# Altium schematic sheet Full_Proje_Sematik.SchDoc
size A4; SheetNumber: 1; SheetTotal: 3
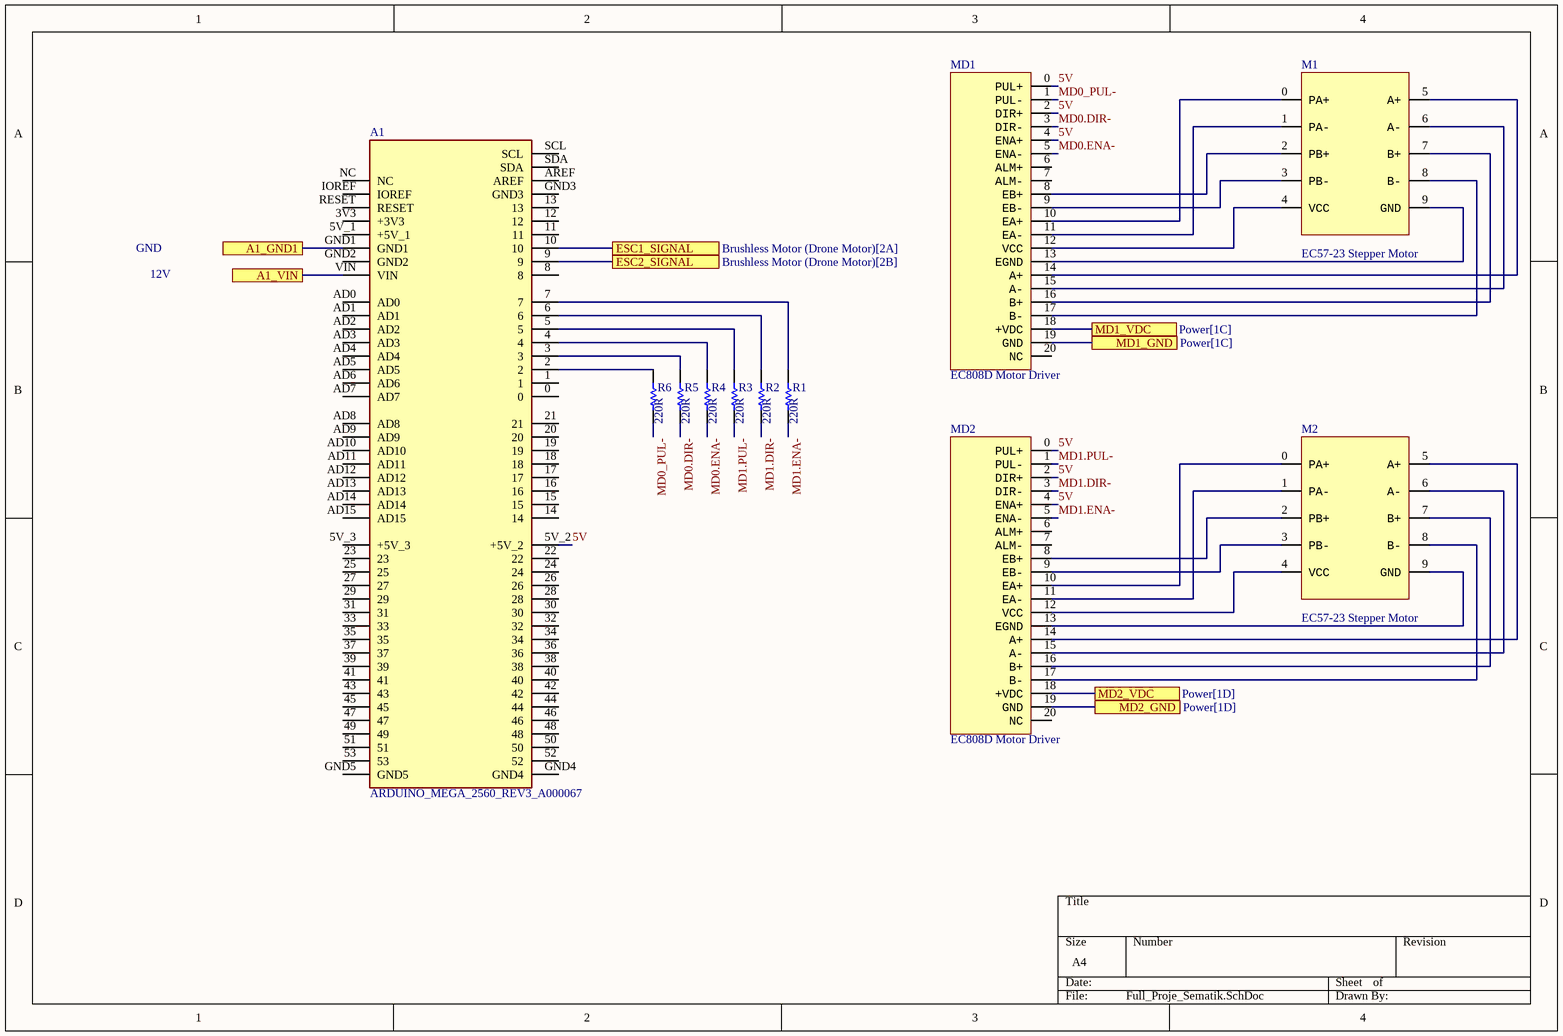
[diagram p0: Full_Proje_Sematik.SchDoc]

## Parts
A1  ARDUINO_MEGA_2560_REV3_A000067  [ARDUINO_ARDUINO_MEGA_2560_REV3_A000067]
M1  EC57-23 Stepper Motor
M2  EC57-23 Stepper Motor
MD1  EC808D Motor Driver
MD2  EC808D Motor Driver
R1  value 220R  (hidden comment: Resistor)
R2  value 220R  (hidden comment: Resistor)
R3  value 220R  (hidden comment: Resistor)
R4  value 220R  (hidden comment: Resistor)
R5  value 220R  (hidden comment: Resistor)
R6  value 220R  (hidden comment: Resistor)

## Ports
A1_GND1, A1_VIN, ESC1_SIGNAL (see Brushless Motor (Drone Motor)[2A]), ESC2_SIGNAL (see Brushless Motor (Drone Motor)[2B]), MD1_GND (see Power[1C]), MD1_VDC (see Power[1C]), MD2_GND (see Power[1D]), MD2_VDC (see Power[1D])

## Nets
5V: A1.5V_2(+5V_2) MD1.0(PUL+) MD1.2(DIR+) MD1.4(ENA+) MD2.0(PUL+) MD2.2(DIR+) MD2.4(ENA+)
A1_GND1: A1.GND1 ; port A1_GND1
A1_VIN: A1.VIN ; port A1_VIN
ESC1_SIGNAL: A1.10 ; port ESC1_SIGNAL
ESC2_SIGNAL: A1.9 ; port ESC2_SIGNAL
MD0.DIR-: MD1.3(DIR-) R5.2
MD0.ENA-: MD1.5(ENA-) R4.2
MD0_PUL-: MD1.1(PUL-) R6.2
MD1.DIR-: MD2.3(DIR-) R2.2
MD1.ENA-: MD2.5(ENA-) R1.2
MD1.PUL-: MD2.1(PUL-) R3.2
MD1_GND: MD1.19(GND) ; port MD1_GND
MD1_VDC: MD1.18(+VDC) ; port MD1_VDC
MD2_GND: MD2.19(GND) ; port MD2_GND
MD2_VDC: MD2.18(+VDC) ; port MD2_VDC
NetA1_2: A1.2 R6.1
NetA1_3: A1.3 R5.1
NetA1_4: A1.4 R4.1
NetA1_5: A1.5 R3.1
NetA1_6: A1.6 R2.1
NetA1_7: A1.7 R1.1
NetM1_0: M1.0(PA+) MD1.10(EA+)
NetM1_1: M1.1(PA-) MD1.11(EA-)
NetM1_2: M1.2(PB+) MD1.8(EB+)
NetM1_3: M1.3(PB-) MD1.9(EB-)
NetM1_4: M1.4(VCC) MD1.12(VCC)
NetM1_5: M1.5(A+) MD1.14(A+)
NetM1_6: M1.6(A-) MD1.15(A-)
NetM1_7: M1.7(B+) MD1.16(B+)
NetM1_8: M1.8(B-) MD1.17(B-)
NetM1_9: M1.9(GND) MD1.13(EGND)
NetM2_0: M2.0(PA+) MD2.10(EA+)
NetM2_1: M2.1(PA-) MD2.11(EA-)
NetM2_2: M2.2(PB+) MD2.8(EB+)
NetM2_3: M2.3(PB-) MD2.9(EB-)
NetM2_4: M2.4(VCC) MD2.12(VCC)
NetM2_5: M2.5(A+) MD2.14(A+)
NetM2_6: M2.6(A-) MD2.15(A-)
NetM2_7: M2.7(B+) MD2.16(B+)
NetM2_8: M2.8(B-) MD2.17(B-)
NetM2_9: M2.9(GND) MD2.13(EGND)

Not connected (* = marked no-connect by the designer): A1 0 1 3V3(+3V3) 5V_1(+5V_1) 5V_3(+5V_3) 8 11 12 13 14 15 16 17 18 19 20 21 22 23 24 25 26 27 28 29 30 31 32 33 34 35 36 37 38 39 40 41 42 43 44 45 46 47 48 49 50 51 52 53 AD0 AD1 AD2 AD3 AD4 AD5 AD6 AD7 AD8 AD9 AD10 AD11 AD12 AD13 AD14 AD15 AREF GND2 GND3 GND4 GND5 IOREF NC RESET SCL SDA; MD1 6(ALM+) 7(ALM-) 20(NC); MD2 6(ALM+) 7(ALM-) 20(NC)

## Notes on the sheet
- GND
- 12V

## Library data of the parts
A1 = ARDUINO_MEGA_2560_REV3_A000067: ATmega2560 Arduino Mega2560 AVRÂ® ATmega AVR MCU 8-Bit Embedded Evaluation Board; MP: ARDUINO MEGA 2560 REV3 ¦ A000067; SnapEDA_Link: https://www.snapeda.com/parts/ARDUINO%20MEGA%202560%20REV3%20%7C%20A000067/Arduino/view-part/?ref=snap; Package: Non-Standard Arduino; Value: *; MF: Arduino; Check_prices: https://www.snapeda.com/parts/ARDUINO%20MEGA%202560%20REV3%20%7C%20A000067/Arduino/view-part/?ref=eda
R1-R6 = Resistor: TC1: 0; SimulationGenericComponent: True; TC2: 0